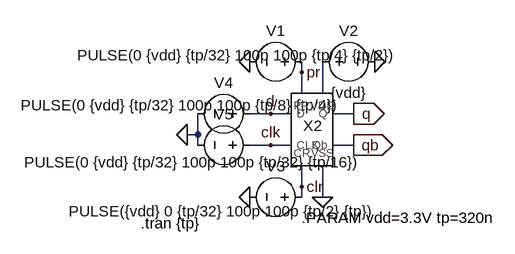
[diagram p0: schematic dff_with_pc_tb.asc]
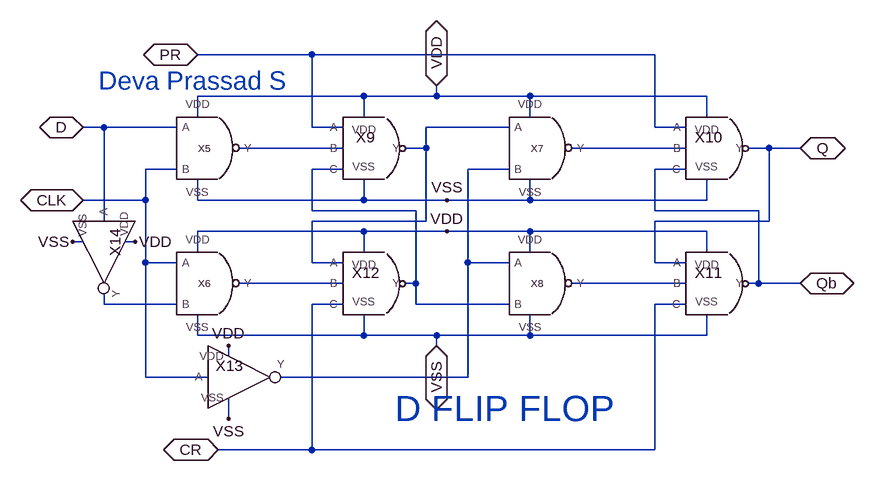
[diagram p1: sub-circuit dff_with_pc.asc]
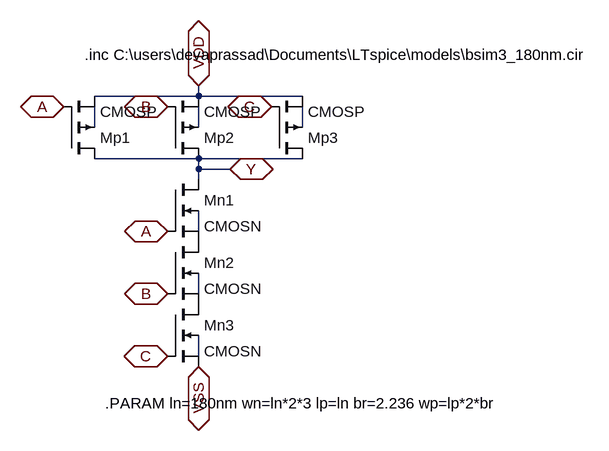
[diagram p2: sub-circuit nand3.asc]
dff_with_pc_tb.asc, the LTspice schematic file:
Version 4.1
SHEET 1 880 680
WIRE 176 64 176 48
WIRE 176 96 176 64
WIRE 208 96 208 48
WIRE 128 128 96 128
WIRE 160 128 128 128
WIRE 256 128 224 128
WIRE 16 160 16 128
WIRE 16 160 0 160
WIRE 16 176 16 160
WIRE 128 176 96 176
WIRE 160 176 128 176
WIRE 256 176 224 176
WIRE 176 240 176 208
WIRE 176 256 176 240
WIRE 208 256 208 208
FLAG 0 160 0
FLAG 96 256 0
FLAG 288 48 0
FLAG 96 48 0
FLAG 208 256 0
FLAG 256 128 q
IOPIN 256 128 Out
FLAG 256 176 qb
IOPIN 256 176 Out
FLAG 128 128 d
FLAG 128 176 clk
FLAG 176 240 clr
FLAG 176 64 pr
SYMBOL voltage 192 48 R90
WINDOW 0 -32 56 VBottom 2
WINDOW 3 -26 113 VTop 2
WINDOW 123 0 0 Left 0
WINDOW 39 0 0 Left 0
SYMATTR InstName V1
SYMATTR Value PULSE(0 {vdd} {tp/32} 100p 100p {tp/4} {tp/2})
SYMBOL voltage 192 48 R270
WINDOW 0 32 56 VTop 2
WINDOW 3 -32 56 VBottom 2
WINDOW 123 0 0 Left 0
WINDOW 39 0 0 Left 0
SYMATTR InstName V2
SYMATTR Value {vdd}
SYMBOL voltage 192 256 R90
WINDOW 0 -32 56 VBottom 2
WINDOW 3 6 136 VTop 2
WINDOW 123 0 0 Left 0
WINDOW 39 0 0 Left 0
SYMATTR InstName V3
SYMATTR Value PULSE({vdd} 0 {tp/32} 100p 100p {tp/2} {tp})
SYMBOL voltage 112 128 R90
WINDOW 0 -32 56 VBottom 2
WINDOW 3 -29 120 VTop 2
WINDOW 123 0 0 Left 0
WINDOW 39 0 0 Left 0
SYMATTR InstName V4
SYMATTR Value PULSE(0 {vdd} {tp/32} 100p 100p {tp/8} {tp/4})
SYMBOL voltage 112 176 R90
WINDOW 0 -32 56 VBottom 2
WINDOW 3 11 101 VTop 2
WINDOW 123 0 0 Left 0
WINDOW 39 0 0 Left 0
SYMATTR InstName V5
SYMATTR Value PULSE(0 {vdd} {tp/32} 100p 100p {tp/32} {tp/16})
SYMBOL work\\Dff_with_pc 192 176 R0
SYMATTR InstName X2
TEXT 176 288 Left 2 !.PARAM vdd=3.3V tp=320n
TEXT -72 296 Left 2 !.tran {tp}

dff_with_pc.asc, the sub-circuit schematic file:
Version 4.1
SHEET 1 952 680
WIRE 144 -48 -32 -48
WIRE 672 -48 144 -48
WIRE 224 16 -32 16
WIRE 336 16 336 0
WIRE 336 16 224 16
WIRE 480 16 336 16
WIRE 752 16 480 16
WIRE -32 48 -32 16
WIRE 224 48 224 16
WIRE 480 48 480 16
WIRE 752 48 752 16
WIRE -176 64 -208 64
WIRE -64 64 -176 64
WIRE 144 64 144 -48
WIRE 192 64 144 64
WIRE 448 64 320 64
WIRE 672 64 672 -48
WIRE 720 64 672 64
WIRE 192 96 32 96
WIRE 320 96 320 64
WIRE 320 96 288 96
WIRE 720 96 544 96
WIRE 848 96 816 96
WIRE 896 96 848 96
WIRE -64 128 -112 128
WIRE 192 128 144 128
WIRE 448 128 384 128
WIRE 720 128 672 128
WIRE -112 176 -112 128
WIRE -112 176 -208 176
WIRE -32 176 -32 144
WIRE 224 176 224 144
WIRE 224 176 -32 176
WIRE 352 176 224 176
WIRE 480 176 480 144
WIRE 480 176 352 176
WIRE 752 176 752 144
WIRE 752 176 480 176
WIRE 144 192 144 128
WIRE 304 192 144 192
WIRE 672 192 672 128
WIRE 832 192 672 192
WIRE -176 208 -176 64
WIRE 320 208 320 96
WIRE 320 208 144 208
WIRE 848 208 848 96
WIRE 848 208 672 208
WIRE 224 224 -32 224
WIRE 352 224 224 224
WIRE 480 224 352 224
WIRE 752 224 480 224
WIRE -208 240 -224 240
WIRE -128 240 -144 240
WIRE -32 256 -32 224
WIRE 224 256 224 224
WIRE 480 256 480 224
WIRE 752 256 752 224
WIRE -112 272 -112 176
WIRE -64 272 -112 272
WIRE 144 272 144 208
WIRE 192 272 144 272
WIRE 384 272 384 128
WIRE 448 272 384 272
WIRE 672 272 672 208
WIRE 720 272 672 272
WIRE 192 304 32 304
WIRE 304 304 304 192
WIRE 304 304 288 304
WIRE 720 304 544 304
WIRE 832 304 832 192
WIRE 832 304 816 304
WIRE 896 304 832 304
WIRE -176 336 -176 320
WIRE -64 336 -176 336
WIRE 192 336 144 336
WIRE 304 336 304 304
WIRE 448 336 304 336
WIRE 720 336 672 336
WIRE -32 384 -32 352
WIRE 224 384 224 352
WIRE 224 384 -32 384
WIRE 336 384 224 384
WIRE 480 384 480 352
WIRE 480 384 336 384
WIRE 752 384 752 352
WIRE 752 384 480 384
WIRE 336 400 336 384
WIRE 16 416 16 400
WIRE -112 448 -112 272
WIRE -16 448 -112 448
WIRE 384 448 384 272
WIRE 384 448 96 448
WIRE 16 512 16 480
WIRE 144 560 144 336
WIRE 144 560 0 560
WIRE 672 560 672 336
WIRE 672 560 144 560
FLAG -208 64 D
IOPIN -208 64 BiDir
FLAG 896 96 Q
IOPIN 896 96 BiDir
FLAG 896 304 Qb
IOPIN 896 304 BiDir
FLAG -32 -48 PR
IOPIN -32 -48 BiDir
FLAG 0 560 CR
IOPIN 0 560 BiDir
FLAG 336 0 VDD
IOPIN 336 0 BiDir
FLAG 336 400 VSS
IOPIN 336 400 BiDir
FLAG -224 240 VSS
FLAG 352 176 VSS
FLAG 16 512 VSS
FLAG -128 240 VDD
FLAG 352 224 VDD
FLAG 16 400 VDD
FLAG -208 176 CLK
IOPIN -208 176 BiDir
SYMBOL diglib\\basic_cells\\nand1x\\nand1x -16 96 R0
SYMATTR InstName X5
SYMBOL diglib\\basic_cells\\nand1x\\nand1x -16 304 R0
SYMATTR InstName X6
SYMBOL diglib\\basic_cells\\nand1x\\nand1x 496 96 R0
SYMATTR InstName X7
SYMBOL diglib\\basic_cells\\nand1x\\nand1x 496 304 R0
SYMATTR InstName X8
SYMBOL diglib\\basic_cells\\nand1x\\nand3 256 128 R0
SYMATTR InstName X9
SYMBOL diglib\\basic_cells\\nand1x\\nand3 784 128 R0
SYMATTR InstName X10
SYMBOL diglib\\basic_cells\\nand1x\\nand3 784 336 R0
SYMATTR InstName X11
SYMBOL diglib\\basic_cells\\nand1x\\nand3 256 336 R0
SYMATTR InstName X12
SYMBOL diglib\\basic_cells\\inv1x\\inv1x 48 448 R0
SYMATTR InstName X13
SYMBOL diglib\\basic_cells\\inv1x\\inv1x -176 272 R90
SYMATTR InstName X14
TEXT 272 496 Left 5 ;D FLIP FLOP
TEXT -184 -8 Left 4 ;Deva Prassad S

nand3.asc, the sub-circuit schematic file:
Version 4.1
SHEET 1 880 680
WIRE 208 -64 208 -80
WIRE 208 -64 48 -64
WIRE 368 -64 208 -64
WIRE 48 -16 48 -48
WIRE 208 -16 208 -48
WIRE 368 -16 368 -48
WIRE 208 32 48 32
WIRE 368 32 208 32
WIRE 208 48 208 32
WIRE 256 48 208 48
WIRE 208 64 208 48
WIRE 208 144 208 112
WIRE 208 240 208 208
WIRE 208 336 208 304
FLAG 0 -48 A
IOPIN 0 -48 BiDir
FLAG 160 -48 B
IOPIN 160 -48 BiDir
FLAG 320 -48 C
IOPIN 320 -48 BiDir
FLAG 160 144 A
IOPIN 160 144 BiDir
FLAG 160 240 B
IOPIN 160 240 BiDir
FLAG 160 336 C
IOPIN 160 336 BiDir
FLAG 208 352 VSS
IOPIN 208 352 BiDir
FLAG 208 -80 VDD
IOPIN 208 -80 BiDir
FLAG 256 48 Y
IOPIN 256 48 BiDir
SYMBOL nmos4 160 64 R0
SYMATTR InstName Mn1
SYMATTR Value CMOSN
SYMATTR Value2 l={ln} w={wn} ad={ln*wn} as={ln*wn} pd={2*ln+wn} ps={2*ln+wn}
SYMBOL pmos4 0 32 M180
SYMATTR InstName Mp1
SYMATTR Value CMOSP
SYMATTR Value2 l={lp} w={wp} ad={lp*wp} as={lp*wp} pd={2*lp+wp} ps={2*lp+wp}
SYMBOL nmos4 160 160 R0
SYMATTR InstName Mn2
SYMATTR Value CMOSN
SYMATTR Value2 l={ln} w={wn} ad={ln*wn} as={ln*wn} pd={2*ln+wn} ps={2*ln+wn}
SYMBOL nmos4 160 256 R0
SYMATTR InstName Mn3
SYMATTR Value CMOSN
SYMATTR Value2 l={ln} w={wn} ad={ln*wn} as={ln*wn} pd={2*ln+wn} ps={2*ln+wn}
SYMBOL pmos4 160 32 M180
SYMATTR InstName Mp2
SYMATTR Value CMOSP
SYMATTR Value2 l={lp} w={wp} ad={lp*wp} as={lp*wp} pd={2*lp+wp} ps={2*lp+wp}
SYMBOL pmos4 320 32 M180
SYMATTR InstName Mp3
SYMATTR Value CMOSP
SYMATTR Value2 l={lp} w={wp} ad={lp*wp} as={lp*wp} pd={2*lp+wp} ps={2*lp+wp}
TEXT 32 -128 Left 2 !.inc C:\\users\\devaprassad\\Documents\\LTspice\\models\\bsim3_180nm.cir
TEXT 64 408 Left 2 !.PARAM ln=180nm wn=ln*2*3 lp=ln br=2.236 wp=lp*2*br

The netlist it stands for:
* dff_with_pc_tb.asc
V1 pr 0 PULSE(0 {vdd} {tp/32} 100p 100p {tp/4} {tp/2})
V2 N001 0 {vdd}
V3 clr 0 PULSE({vdd} 0 {tp/32} 100p 100p {tp/2} {tp})
V4 d 0 PULSE(0 {vdd} {tp/32} 100p 100p {tp/8} {tp/4})
V5 clk 0 PULSE(0 {vdd} {tp/32} 100p 100p {tp/32} {tp/16})
X§X2 clr d pr q qb N001 0 clk dff_with_pc

* block symbol definitions
.subckt dff_with_pc CR D PR Q Qb VDD VSS CLK
X§X5 N002 VDD VSS D CLK nand1x  ; pins Y VDD VSS A B
X§X6 N006 VDD VSS CLK N008 nand1x  ; pins Y VDD VSS A B
X§X7 N003 VDD VSS N001 N005 nand1x  ; pins Y VDD VSS A B
X§X8 N007 VDD VSS N005 N004 nand1x  ; pins Y VDD VSS A B
X§X9 PR N002 N004 VDD VSS N001 nand3
X§X10 PR N003 Qb VDD VSS Q nand3
X§X11 Q N007 CR VDD VSS Qb nand3
X§X12 N001 N006 CR VDD VSS N004 nand3
X§X13 CLK VDD VSS N005 inv1x  ; pins A VDD VSS Y
X§X14 D VDD VSS N008 inv1x  ; pins A VDD VSS Y
* D FLIP FLOP
* Deva Prassad S
.ends dff_with_pc

.subckt nand3 A B C VDD VSS Y
Mn1 Y A P001 N004 CMOSN l={ln} w={wn} ad={ln*wn} as={ln*wn} pd={2*ln+wn} ps={2*ln+wn}
Mp1 Y A VDD N001 CMOSP l={lp} w={wp} ad={lp*wp} as={lp*wp} pd={2*lp+wp} ps={2*lp+wp}
Mn2 P001 B P002 N005 CMOSN l={ln} w={wn} ad={ln*wn} as={ln*wn} pd={2*ln+wn} ps={2*ln+wn}
Mn3 P002 C VSS N006 CMOSN l={ln} w={wn} ad={ln*wn} as={ln*wn} pd={2*ln+wn} ps={2*ln+wn}
Mp2 Y B VDD N002 CMOSP l={lp} w={wp} ad={lp*wp} as={lp*wp} pd={2*lp+wp} ps={2*lp+wp}
Mp3 Y C VDD N003 CMOSP l={lp} w={wp} ad={lp*wp} as={lp*wp} pd={2*lp+wp} ps={2*lp+wp}
.inc C:\users\devaprassad\Documents\LTspice\models\bsim3_180nm.cir
.PARAM ln=180nm wn=ln*2*3 lp=ln br=2.236 wp=lp*2*br
.ends nand3

.model NMOS NMOS
.model PMOS PMOS
.lib standard.mos
.PARAM vdd=3.3V tp=320n
.tran {tp}
.backanno
.end